# Altium schematic sheet PwrObj.SchDoc
size A3; SheetNumber: 2; SheetTotal: 3
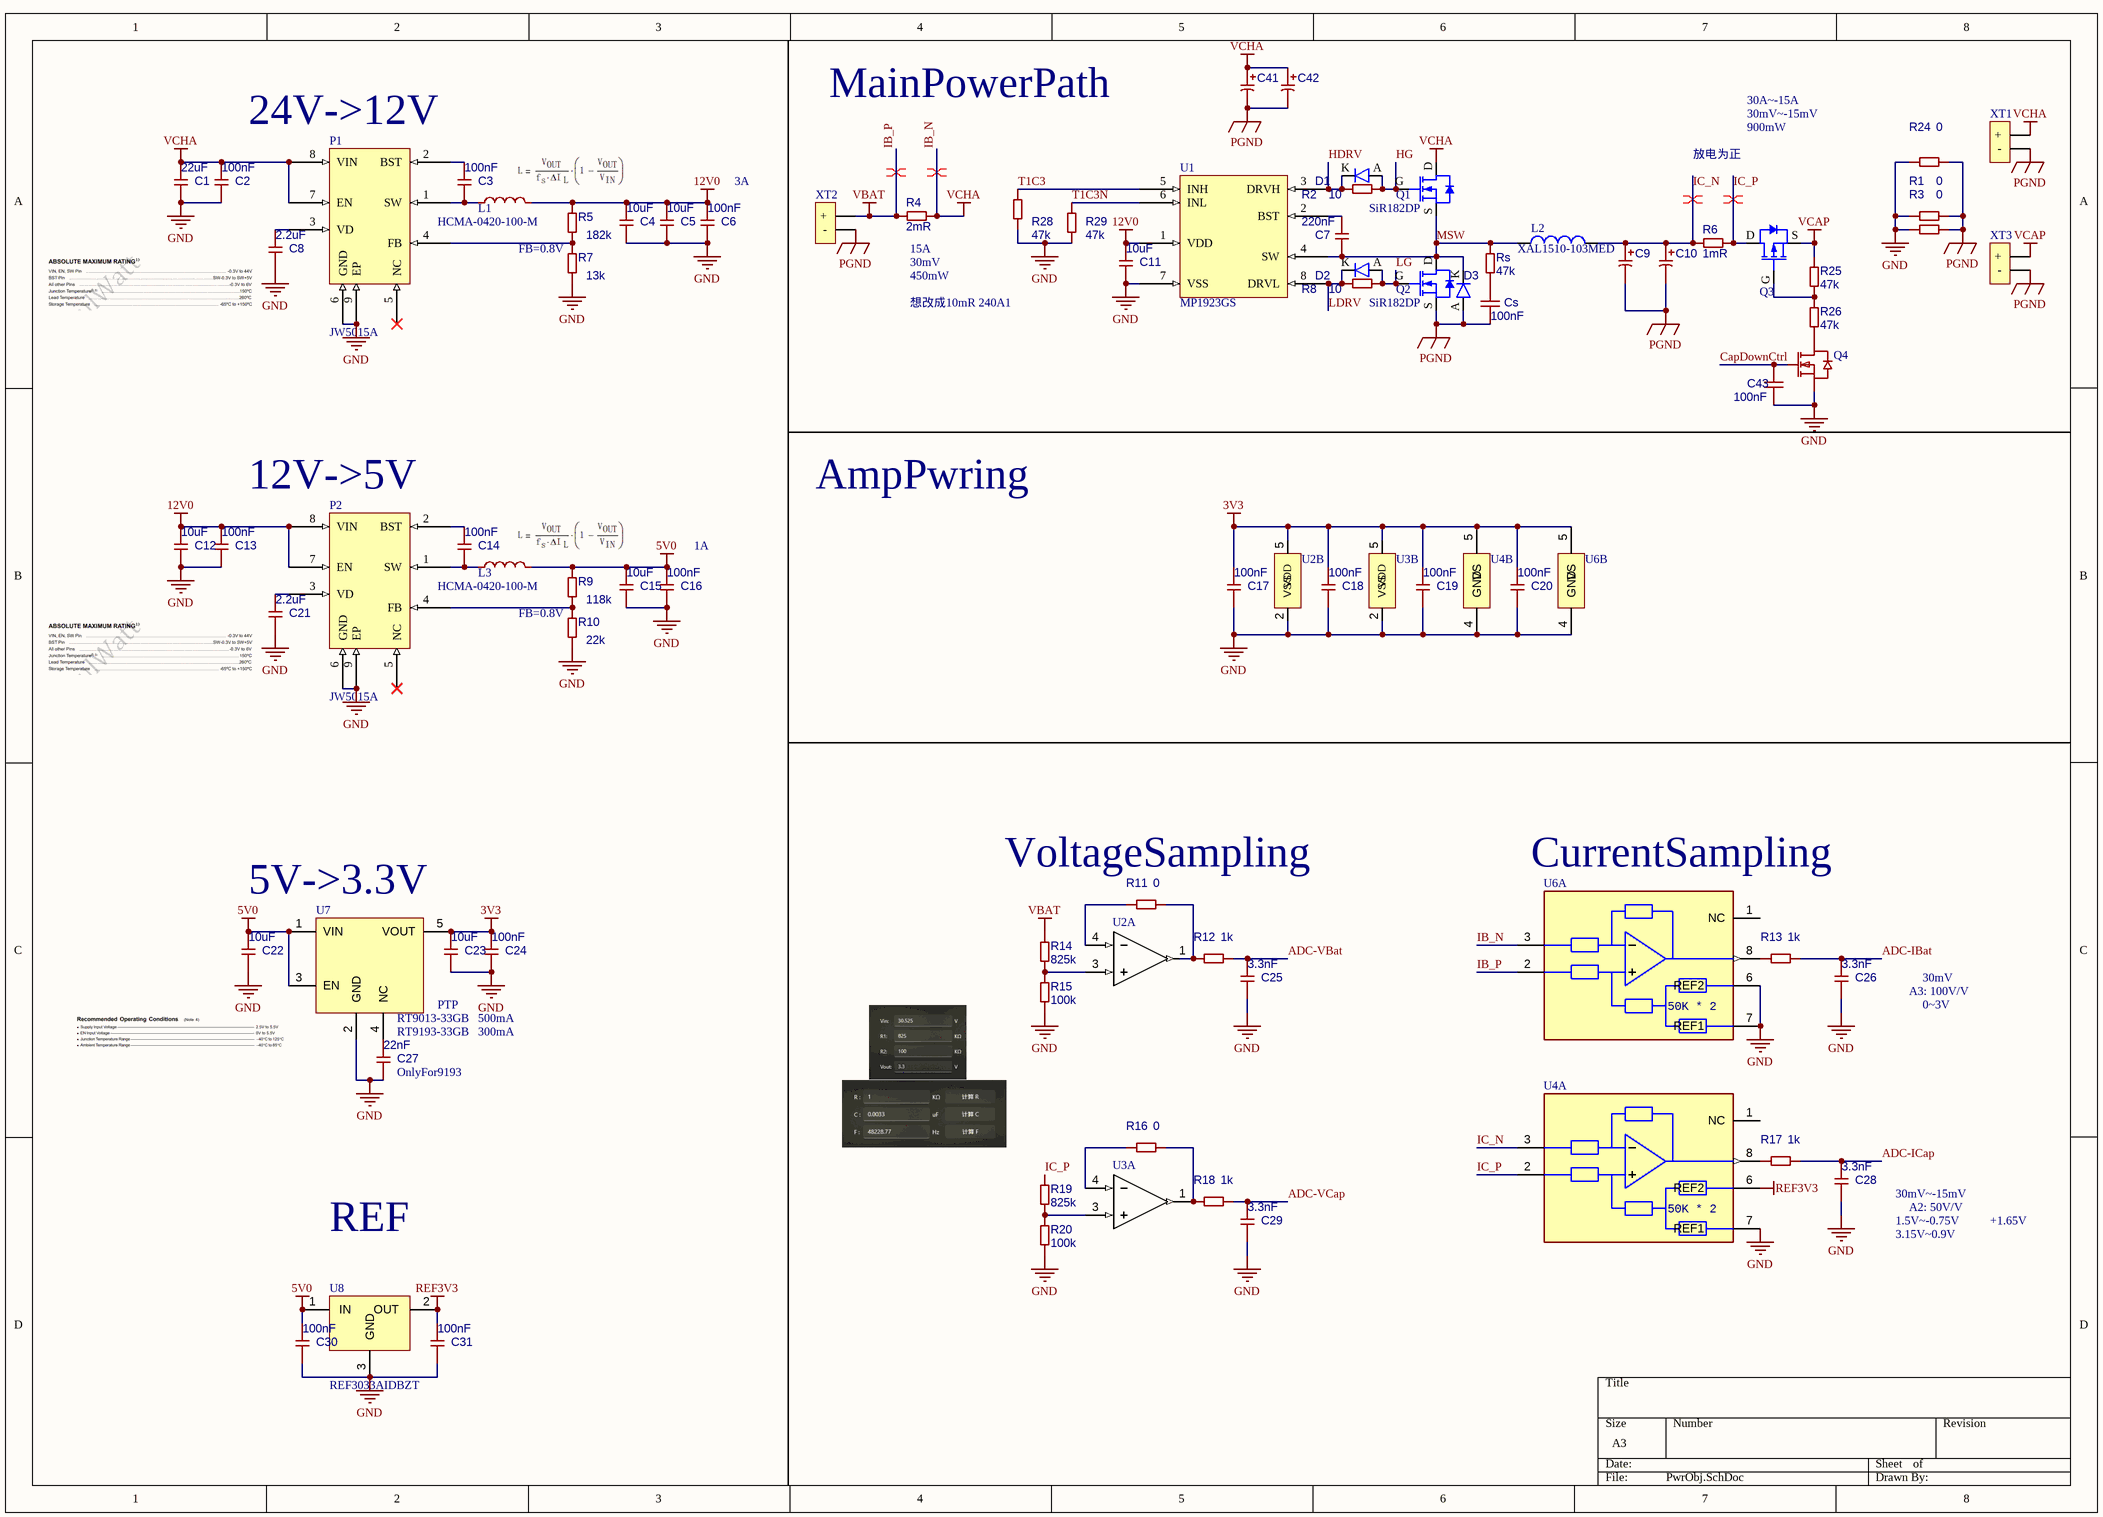
[diagram p0: PwrObj.SchDoc]

## Parts
C1  22uF  [1206M]
C2  100nF  [0603M]
C3  100nF  [0603M]
C4  10uF  [0805M]
C5  10uF  [0805M]
C6  100nF  [0603M]
C7  220nF  [0603M]
C8  2.2uF  [0603M]
C9  220uF/35V  [D6.3*L12]  (value not drawn)
C10  220uF/35V  [D6.3*L12]  (value not drawn)
C11  10uF  [0805M]
C12  10uF  [0805M]
C13  100nF  [0603M]
C14  100nF  [0603M]
C15  10uF  [0603M]
C16  100nF  [0603M]
C17  100nF  [0603M]
C18  100nF  [0603M]
C19  100nF  [0603M]
C20  100nF  [0603M]
C21  2.2uF  [0603M]
C22  10uF  [0603M]
C23  10uF  [0603M]
C24  100nF  [0603M]
C25  3.3nF  [0603M]
C26  3.3nF  [0603M]
C27  22nF  [0603M]
C28  3.3nF  [0603M]
C29  3.3nF  [0603M]
C30  100nF  [0603M]
C31  100nF  [0603M]
C41  220uF/35V  [D6.3*L12]  (value not drawn)
C42  220uF/35V  [D6.3*L12]  (value not drawn)
C43  100nF  [0603M]
Cs  100nF  [0603M]
D1  1N4148W  [SOD-123]  (value not drawn)
D2  1N4148W  [SOD-123]  (value not drawn)
D3  NHS-D-SMD  [SMB]  (value not drawn)
L1  HCMA-0420-100-M  [0420]
L2  XAL1510-103MED  [New footprint 1]
L3  HCMA-0420-100-M  [0420]
P1  JW5015A  [SOP127P600X170_HS-9N]
P2  JW5015A  [SOP127P600X170_HS-9N]
Q1  SiR182DP  [Copy of FAIR-SOT23-3_V]
Q2  SiR182DP  [Copy of FAIR-SOT23-3_V]
Q3  NHS-PMOS-PowerPAK_SO-8  [Copy of FAIR-SOT23-3_V]  (value not drawn)
Q4  SOT-23_NMOS  [SOT-23]  (value not drawn)
R1  0  [1206M]
R2  10  [0603M]
R3  0  [0603M]
R4  2mR  [2512M]
R5  182k  [0603M]
R6  1mR  [2512M]
R7  13k  [0603M]
R8  10  [0603M]
R9  118k  [0603M]
R10  22k  [0603M]
R11  0  [0603M]
R12  1k  [0603M]
R13  1k  [0603M]
R14  825k  [0603M]
R15  100k  [0603M]
R16  0  [0603M]
R17  1k  [0603M]
R18  1k  [0603M]
R19  825k  [0603M]
R20  100k  [0603M]
R24  0  [0603M]
R25  47k  [0603M]
R26  47k  [0603M]
R28  47k  [0603M]
R29  47k  [0603M]
Rs  47k  [0805M]
U1  MP1923GS  [SOIC127P600X175-8N]
U2  AD8605ARTZ-REEL  [ADI-RJ-5_L]  (value not drawn)  (parts A,B of 2)
U3  AD8605ARTZ-REEL  [ADI-RJ-5_L]  (value not drawn)  (parts A,B of 2)
U4  INA240A1PWR  [FP-PW0008A-MFG]  (value not drawn)  (parts A,B of 2)
U6  INA240A3PWR  [FP-PW0008A-MFG]  (value not drawn)  (parts A,B of 2)
U7  RT9013-33GB  [SOT95P279X130-5N]
U8  REF3033AIDBZT  [DBZ0003A_N]
XT1  XT30F  [XT30F]  (value not drawn)
XT2  XT30M  [XT30F]  (value not drawn)
XT3  XT30M  [XT30F]  (value not drawn)

## Nets
3V3: C17.2 C18.2 C19.2 C20.2 C23.2 C24.2 U2.5(VDD) U3.5(VDD) U4.5(VS) U6.5(VS) U7.5(VOUT)
5V0: C15.2 C16.2 C22.2 C30.2 L3.2 R9.2 U7.1(VIN) U7.3(EN) U8.1(IN)
12V0: C4.2 C5.2 C6.2 C11.2 C12.2 C13.2 L1.2 P2.7(EN) P2.8(VIN) R5.2 U1.1(VDD)
GND: C1.1 C2.1 C4.1 C5.1 C6.1 C8.1 C11.1 C12.1 C13.1 C15.1 C16.1 C17.1 C18.1 C19.1 C20.1 C21.1 C22.1 C23.1 C24.1 C25.1 C26.1 C27.1 C28.1 C29.1 C30.1 C31.1 C43.2 P1.6(GND) P1.9(EP) P2.6(GND) P2.9(EP) Q4.2(S) R1.2 R3.2 R7.1 R10.1 R15.2 R20.2 R24.2 R28.1 R29.1 U1.7(VSS) U2.2(VSS) U3.2(VSS) U4.4(GND) U4.7(REF1) U6.4(GND) U6.6(REF2) U6.7(REF1) U7.2(GND) U8.3(GND)
IB_N: C1.2 C2.2 C41.1 C42.1 P1.7(EN) P1.8(VIN) Q1.D(DRAIN) R4.2 U6.3(IN-) XT1.1(+)  [also labelled VCHA]
IB_P: R4.1 R14.1 U6.2(IN+) XT2.1(+)  [also labelled VBAT]
PGND: C9.2 C10.2 C41.2 C42.2 Cs.2 D3.A(Anode) Q2.S(SOURCE) R1.1 R3.1 R24.1 XT1.2(-) XT2.2(-) XT3.2(-)
REF3V3: C31.2 U4.6(REF2) U8.2(OUT)
VCAP: Q3.S(SOURCE) R25.2 XT3.1(+)
ADC-IBat: C26.2 R13.1
ADC-ICap: C28.2 R17.1
ADC-VBat: C25.2 R12.1
ADC-VCap: C29.2 R18.1
CapDownCtrl: C43.1 Q4.1(G)
HDRV: D1.K(Cathode) R2.2 U1.3(DRVH)
HG: D1.A(Anode) Q1.G(GATE) R2.1
IC_N: C9.1 C10.1 L2.2 R6.1 U4.3(IN-)
IC_P: Q3.D(DRAIN) R6.2 R19.1 U4.2(IN+)
LDRV: D2.K(Cathode) R8.2 U1.8(DRVL)
LG: D2.A(Anode) Q2.G(GATE) R8.1
MSW: C7.1 D3.K(Cathode) L2.1 Q1.S(SOURCE) Q2.D(DRAIN) Rs.2 U1.4(SW)
T1C3: R28.2 U1.5(INH)
T1C3N: R29.2 U1.6(INL)
NetC3_1: C3.1 L1.1 P1.1(SW)
NetC3_2: C3.2 P1.2(BST)
NetC7_2: C7.2 U1.2(BST)
NetC8_2: C8.2 P1.3(VD)
NetC14_1: C14.1 L3.1 P2.1(SW)
NetC14_2: C14.2 P2.2(BST)
NetC21_2: C21.2 P2.3(VD)
NetC27_2: C27.2 U7.4(NC)
NetCs_1: Cs.1 Rs.1
NetP1_4: P1.4(FB) R5.1 R7.2
NetP2_4: P2.4(FB) R9.1 R10.2
NetQ3_G: Q3.G(GATE) R25.1 R26.2
NetQ4_3: Q4.3(D) R26.1
NetR11_1: R11.1 R12.2 U2.1(OUTA)
NetR11_2: R11.2 U2.4(IN_P)
NetR13_2: R13.2 U6.8(OUT)
NetR14_2: R14.2 R15.1 U2.3(IN_N)
NetR16_1: R16.1 R18.2 U3.1(OUTA)
NetR16_2: R16.2 U3.4(IN_P)
NetR17_2: R17.2 U4.8(OUT)
NetR19_2: R19.2 R20.1 U3.3(IN_N)

Not connected (* = marked no-connect by the designer): P1 5(NC)*; P2 5(NC)*; U4 1(NC); U6 1(NC)

## Layout directives
differential pair: IB_N, IB_P, IC_N, IC_P

## Notes on the sheet
- MainPowerPath
- 30A~-15A
- 30mV~-15mV
- (near P1) 24V->12V
- (near C6) 3A
- 放电为正
- 900mW
- FB=0.8V
- (near R4) 15A
- (near R4) 30mV
- 450mW
- 想改成10mR 240A1
- (near P2) 12V->5V
- AmpPwring
- (near C16) 1A
- 5V->3.3V
- (near R11) VoltageSampling
- (near U6) CurrentSampling
- A3: 100V/V
- 30mV
- RT9193-33GB
- (near U7) PTP
- 500mA
- 300mA
- 0~3V
- (near C27) OnlyFor9193
- REF
- 1.5V~-0.75V
- 3.15V~0.9V
- A2: 50V/V
- +1.65V
- (in symbol CMP-014-00007-3, part A) 50K * 2

## Library data of the parts
C1 = CMP-001-00098-5: 1206/35V
C2 C3 C6 C13 C14 C16-C20 C24-C31 = CMP-001-00098-5: ..
C4 C5 C11 C12 = CMP-001-00098-5: 0805/25V
C7 = CMP-001-00098-5: 0603/25V
C8 C21 = CMP-001-00098-5: 0603/16V
C9 C10 C41 C42 = CMP-001-00105-2: C46550432
C15 = CMP-001-00098-5: 0603/10V
C22 C23 = CMP-001-00098-5: 0603
C43 Cs = CMP-001-00098-4: ..
D1 D2 = CMP-004-00047-2: C7420318
D3 = CMP-004-00047-2
L1 L3 = CMP-006-00060-2: C49190137
L2 = CMP-006-00052-1
P1 P2 = CMP-019-00099-1
Q1 Q2 = CMP-013-00061-1: VishayNMOS; Manufacturer: Fairchild; Rds On Max: 10Ohm; Typical Rise Time: 6.3ns; Power: 360mW; Elements: 1; Nominal Vgs: -1.7V; Nominal Dual Supply Voltage: -50V; Input Capacitance: 73pF; Package Version: Rev. 12, 03/2016; Mounting Technology: SM; Packaging: TapeandReel; Max Operating Temperature: 150°C; RoHS Compliant: True; Package Quantity: 3000; Min Operating Temperature: -55°C; Datasheet Version: Rev. 1.1.0, 02/2013; Case/Package: TO-236-3; Package Reference: SOT23-3; Package Description: 3-Pin Small Outline Transistor, Body 2.92 x 1.325 mm, Pitch 0.95 mm; Datasheet URL: https://www.fairchildsemi.com/datasheets/BS/BSS84.pdf; Pins: 3
Q3 = CMP-013-00058-7: VishayPMOS; Manufacturer: Fairchild; Package Version: Rev. 12, 03/2016; Power: 360mW; Nominal Dual Supply Voltage: -50V; Elements: 1; Input Capacitance: 73pF; Rds On Max: 10Ohm; Typical Rise Time: 6.3ns; Nominal Vgs: -1.7V; Pins: 3; Datasheet URL: https://www.fairchildsemi.com/datasheets/BS/BSS84.pdf; Min Operating Temperature: -55°C; Max Operating Temperature: 150°C; Package Quantity: 3000; RoHS Compliant: True; Datasheet Version: Rev. 1.1.0, 02/2013; Case/Package: TO-236-3; Packaging: TapeandReel; Mounting Technology: SM; Package Description: 3-Pin Small Outline Transistor, Body 2.92 x 1.325 mm, Pitch 0.95 mm; Package Reference: SOT23-3
Q4 = CMP-013-00047-5: C22446827
R1-R20 R24-R26 R28 R29 Rs = CMP-009-00191-3: ..
U1 = CMP-00024-00011-1
U2 U3 = CMP-014-00006-2: IC OPAMP GP 1 CIRCUIT SOT23-5 General Purpose Amplifier 1 Circuit Rail-to-Rail SOT-23-5; Max Supply Voltage: 5.5V; Min Supply Voltage: 2.7V; Min Operating Temperature: -40°C; Max Operating Temperature: 125°C; Case/Package: SOT-23-5; Pins: 5
U4 U6 = CMP-014-00007-3: Op Amp Single Zero Drift Amplifier 5.5V 8-Pin TSSOP T/R; Min Supply Voltage: 2.7V; Pins: 8; Min Operating Temperature: -40°C; Max Operating Temperature: 125°C; Max Supply Voltage: 5.5V; Case/Package: TSSOP
U7 = CMP-019-00071-2: Regulator
U8 = CMP-019-00109-1: 50ppm/°C drift, 50µA Iq in SOT-23-3 package series voltage reference 3-SOT-23 -40 to 125; Max Supply Voltage: 5.5V; Output Voltage: 3.3V; Output Current: 25mA; Pins: 3; Max Operating Temperature: 125°C; Min Operating Temperature: -40°C; Case/Package: SOT-23
XT1-XT3 = CMP-002-00098-3: .